# Altium schematic sheet ADC_A.SchDoc
size A4; SheetNumber: 8; SheetTotal: 8
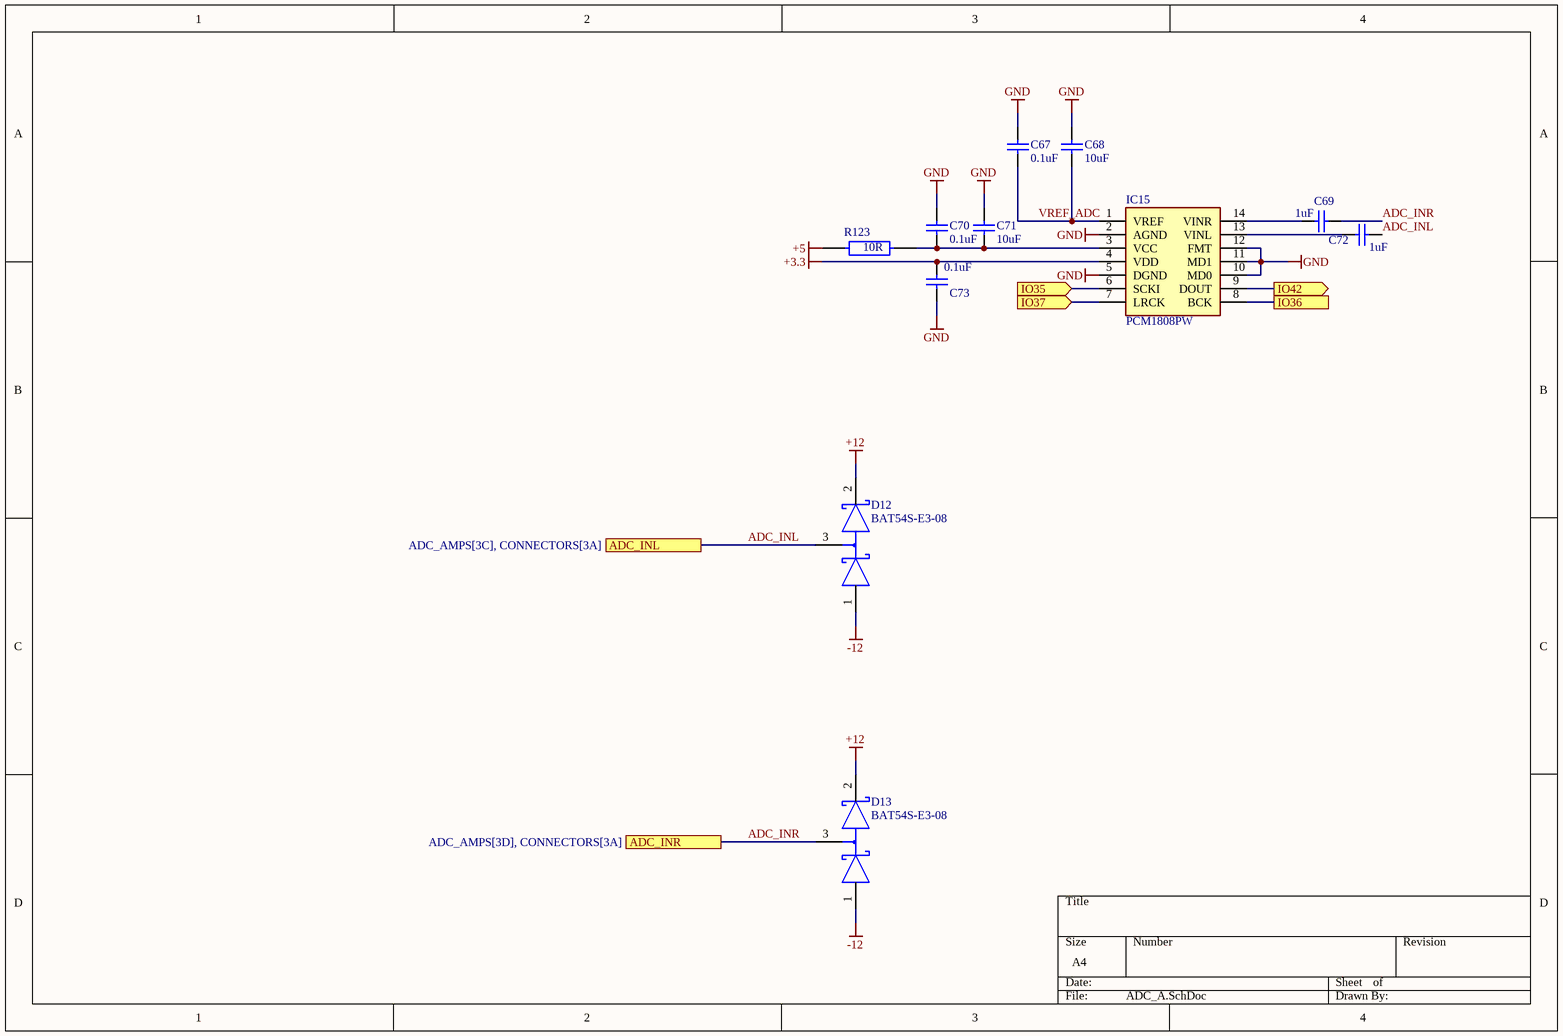
[diagram p0: ADC_A.SchDoc]

## Parts
C67  0.1uF  [CAPC2013X145X48NL20T23]
C68  10uF  [CAPC2013X145X48NL20T23]
C69  1uF  [CAPC2013X145X48NL20T23]
C70  0.1uF  [CAPC2013X145X48NL20T23]
C71  10uF  [CAPC2013X145X48NL20T23]
C72  1uF  [CAPC2013X145X48NL20T23]
C73  0.1uF  [CAPC2013X145X48NL20T23]
D12  BAT54S-E3-08  [FP-6_541-5014_01-4-IPC_A]
D13  BAT54S-E3-08  [FP-6_541-5014_01-4-IPC_A]
IC15  PCM1808PW  [SOP65P640X120-14N]
R123  10R  [FP-RN73R2A-IPC_A]

## Ports
ADC_INL (see ADC_AMPS[3C], CONNECTORS[3A]), ADC_INR (see ADC_AMPS[3D], CONNECTORS[3A]), IO35 (in), IO36, IO37 (in), IO42 (out)

## Nets
+3.3: C73.2 IC15.4(VDD)
+5: R123.2
+12: D12.2 D13.2
-12: D12.1 D13.1
GND: C67.1 C68.1 C70.1 C71.1 C73.1 IC15.2(AGND) IC15.5(DGND) IC15.10(MD0) IC15.11(MD1) IC15.12(FMT)
ADC_INL: C72.1 D12.3 ; port ADC_INL
ADC_INR: C69.1 D13.3 ; port ADC_INR
IO35: IC15.6(SCKI) ; port IO35
IO36: IC15.8(BCK) ; port IO36
IO37: IC15.7(LRCK) ; port IO37
IO42: IC15.9(DOUT) ; port IO42
VREF_ADC: C67.2 C68.2 IC15.1(VREF)
NetC69_2: C69.2 IC15.14(VINR)
NetC70_2: C70.2 C71.2 IC15.3(VCC) R123.1
NetC72_2: C72.2 IC15.13(VINL)

## Library data of the parts
C67-C73 = CAP: Manufacturer: Vitramon; Part Number: VJ0805Y682KXAMT
D12 D13 = BAT54S: DIODE ARRAY SCHOTTKY 30V SOT23; Manufacturer: Vishay; Capacitance: 10pF; Forward Current: 200mA; Max Junction Temp: +125°C; Value: 10pF; Max Surge Forward Current: 600mA; Peak Reverse Current: 2uA; Temperature: -55°C to +125°C; Device Class L1: Discrete Semiconductors; Height: 1.15mm; ComponentLink2Description: Datasheet; Mouser Description: Schottky Diodes & Rectifiers 200mA 30 Volt; Max Repetitive Reverse Voltage: 30V; Manufacturer Part Number: BAT54S-E3-08; Package: 6.541-5014.01-4; Temperature Range High: +125°C; Digikey Description: DIODE ARRAY SCHOTTKY 30V SOT23; Device Class L2: Diodes; ComponentLink2URL: http://www.vishay.com/docs/85508/bat54.pdf; RoHS: TRUE; Octopart: https://octopart.com/bat54s-e3-08-vishay-29186616; Automotive: No; Lead Free: Yes; Category: Diode; Temperature Range Low: -55°C; Device Class L3: Schottky Diodes
IC15 = PCM1808PW: 99dB SNR Stereo ADC With Single-Ended Inputs; Manufacturer_Name: Texas Instruments; Geometry.Height: 1.2mm; Mouser Part Number: 595-PCM1808PW; Mouser Price/Stock: https://www.mouser.co.uk/ProductDetail/Texas-Instruments/PCM1808PW?qs=iSMark9AYDWYQaMpH%2FhwPg%3D%3D; Manufacturer_Part_Number: PCM1808PW; Datasheet Link: http://www.ti.com/lit/gpn/pcm1808
R123 = Resistor: RES 10K OHM 0.1% 1/8W 0805